# Altium project Master.PrjPcb (part 1 of 3)
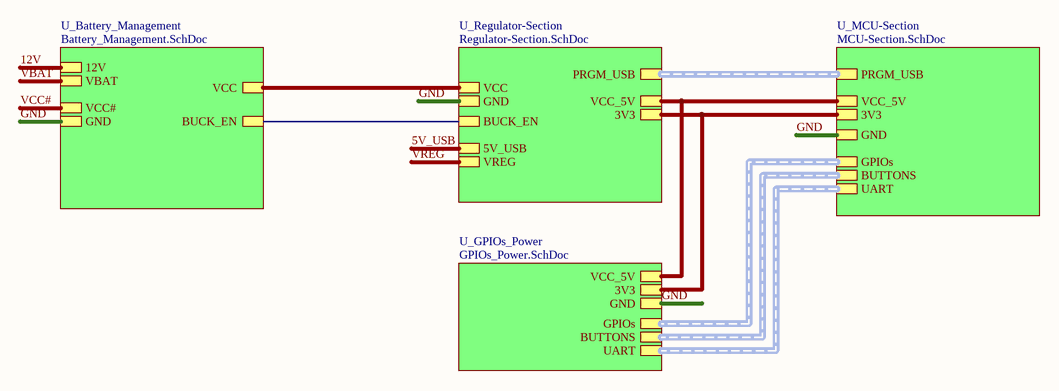
[diagram p0: Top_Sheet.SchDoc]
5 sheets, 132 parts. Net scope: hierarchical (ports join the sheet entries above them; power ports are global).
Board file: Catan_board.PcbDoc
Sheets:
  Top_Sheet.SchDoc
    U_Regulator-Section = Regulator-Section.SchDoc
    U_Battery_Management = Battery_Management.SchDoc
    U_MCU-Section = MCU-Section.SchDoc
    U_GPIOs_Power = GPIOs_Power.SchDoc

## Sheet Top_Sheet.SchDoc
size A4; SheetNumber: 1; SheetTotal: 5

### Sub-sheets
U_Battery_Management = Battery_Management.SchDoc: BUCK_EN, GND, VCC#, VCC, VBAT, 12V
U_GPIOs_Power = GPIOs_Power.SchDoc: 3V3, GND, VCC_5V, GPIOs (harness GPIOs), BUTTONS (harness BUTTONS), UART (harness UART)
U_MCU-Section = MCU-Section.SchDoc: 3V3, GND, VCC_5V, PRGM_USB (harness PRGM_USB), GPIOs (harness GPIOs), BUTTONS (harness BUTTONS), UART (harness UART)
U_Regulator-Section = Regulator-Section.SchDoc: BUCK_EN, 3V3, GND, VCC_5V, VCC, 5V_USB, VREG, PRGM_USB (harness PRGM_USB)

### Nets
3V3: sheet U_Regulator-Section/3V3, sheet U_MCU-Section/3V3, sheet U_GPIOs_Power/3V3
GND: sheet U_Regulator-Section/GND, sheet U_Battery_Management/GND, sheet U_MCU-Section/GND, sheet U_GPIOs_Power/GND
VCC: sheet U_Regulator-Section/VCC, sheet U_Battery_Management/VCC
VCC_5V: sheet U_Regulator-Section/VCC_5V, sheet U_MCU-Section/VCC_5V, sheet U_GPIOs_Power/VCC_5V
BUCK_EN: sheet U_Regulator-Section/BUCK_EN, sheet U_Battery_Management/BUCK_EN

### Buses and harness runs
harness sheet U_GPIOs_Power/BUTTONS = sheet U_MCU-Section/BUTTONS
harness sheet U_GPIOs_Power/GPIOs = sheet U_MCU-Section/GPIOs
harness sheet U_GPIOs_Power/UART = sheet U_MCU-Section/UART
harness sheet U_MCU-Section/PRGM_USB = sheet U_Regulator-Section/PRGM_USB

### Notes on the sheet
- File:
- Title:
- Date:
- Page
- Num:
- Total:
- Drawn By: Huzaifa Ali

## Sheet Regulator-Section.SchDoc
size A4; SheetNumber: 3; SheetTotal: 5
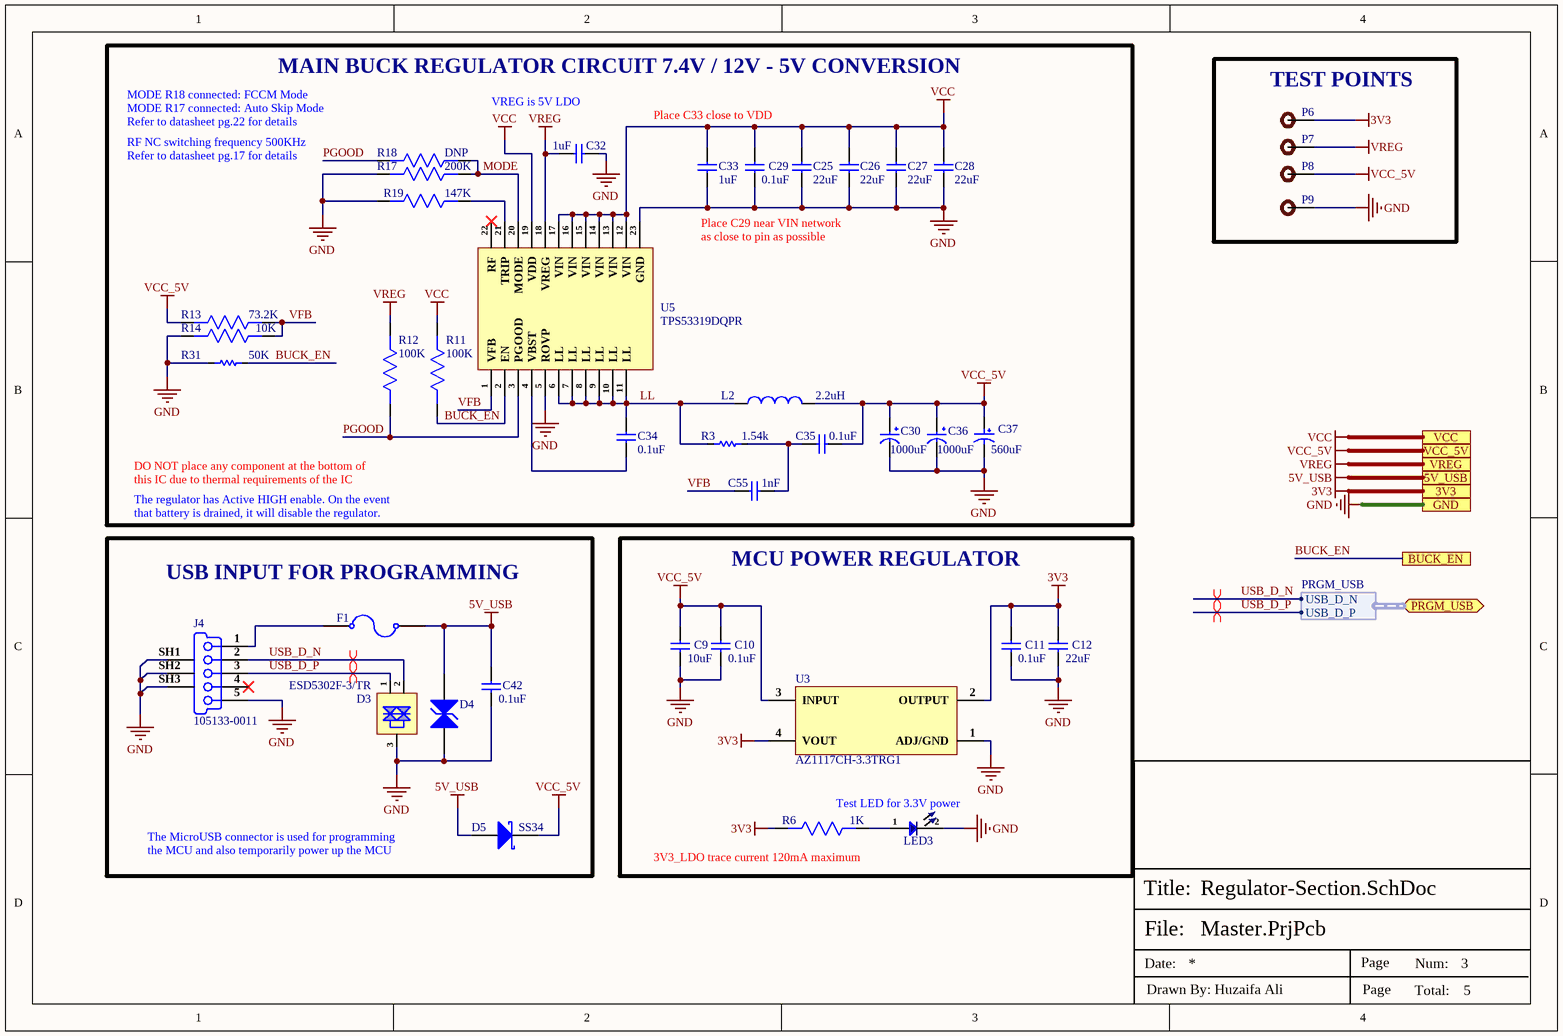
[diagram p1: Regulator-Section.SchDoc]

### Parts
C9  10uF  [Cap-0603]
C10  0.1uF  [Cap-0603]
C11  0.1uF  [Cap-0603]
C12  22uF  [Cap-0603]
C25  22uF  [Cap-0805]
C26  22uF  [Cap-0805]
C27  22uF  [Cap-0805]
C28  22uF  [Cap-0805]
C29  0.1uF  [Cap-0603]
C30  1000uF  [UUD1A102MNL1GS]
C32  1uF  [Cap-0603]
C33  1uF  [Cap-0603]
C34  0.1uF  [Cap-0603]
C35  0.1uF  [Cap-0603]
C36  1000uF  [UUD1A102MNL1GS]
C37  560uF  [GVT1C561M0810]
C42  0.1uF  [Cap-0603]
C55  1nF  [CAP-0603]
D3  ESD5302F-3/TR  [Sot-23]
D4  PESD5V0H1BSFYL  [DSN0603-2]  (value not drawn)
D5  SS34  [SMA]
F1  SMD0603-050  [Fuse-0603]  (value not drawn)
J4  105133-0011  [1051330011]
L2  2.2uH  [BCIH1367-2R2M]
LED3  RED  [LED-0603]  (value not drawn)
P6  TEST POINT  [Test-point]  (value not drawn)
P7  TEST POINT  [Test-point]  (value not drawn)
P8  TEST POINT  [Test-point]  (value not drawn)
P9  TEST POINT  [Test-point]  (value not drawn)
R3  1.54k  [Res-0402]
R6  1K  [Res-0603]
R11  100K  [Res-0603]
R12  100K  [Res-0603]
R13  73.2K  [Res-0603]
R14  10K  [Res-0603]
R17  200K  [Res-0603]
R18  DNP  [Res-0603]
R19  147K  [Res-0603]
R31  50K  [Res-0603]
U3  AZ1117CH-3.3TRG1  [SOT- 223]
U5  TPS53319DQPR  [22-LSON-CLIP (6x5)]

### Blocks framed on the sheet
MAIN BUCK REGULATOR CIRCUIT 7.4V / 12V - 5V CONVERSION: C25-C30 C32-C37 C55 L2 R3 R11-R14 R17-R19 R31 U5
TEST POINTS: P6-P9
USB INPUT FOR PROGRAMMING: C42 D3-D5 F1 J4
MCU POWER REGULATOR: C9-C12 LED3 R6 U3

### Ports
3V3, 5V_USB, BUCK_EN, GND, PRGM_USB (bidir, harness PRGM_USB), VCC, VCC_5V, VREG

### Harnesses
PRGM_USB: USB_D_N, USB_D_P

### Nets
3V3: C11.2 C12.2 P6.1 R6.2 U3.2(OUTPUT) U3.4(VOUT) ; port 3V3
5V_USB: C42.2 D4.1 D5.2(A) F1.2 ; port 5V_USB
GND: C9.1 C10.1 C11.1 C12.1 C25.1 C26.1 C27.1 C28.1 C29.1 C30.2 C32.2 C33.1 C36.2 C37.2 C42.1 D3.3(GND) D4.2 J4.5(GND) J4.SH1 J4.SH2 J4.SH3 LED3.2 P9.1 R14.1 R17.2 R19.2 R31.1 U3.1(ADJ/GND) U5.5(ROVP) U5.23(GND) ; port GND
VCC: C25.2 C26.2 C27.2 C28.2 C29.2 C33.2 R11.1 U5.12(VIN) U5.13(VIN) U5.14(VIN) U5.15(VIN) U5.16(VIN) U5.17(VIN) U5.19(VDD) ; port VCC
VCC_5V: C9.2 C10.2 C30.1 C35.1 C36.1 C37.1 D5.1(K) L2.2 P8.1 R13.2 U3.3(INPUT) ; port VCC_5V
VREG: C32.1 P7.1 R12.1 U5.18(VREG) ; port VREG
BUCK_EN: R11.2 R31.2 U5.2(EN) ; port BUCK_EN
LL: C34.1 L2.1 R3.1 U5.6(LL) U5.7(LL) U5.8(LL) U5.9(LL) U5.10(LL) U5.11(LL)
MODE: R17.1 R18.1 U5.20(MODE)
PGOOD: R12.2 R18.2 U5.3(PGOOD)
USB_D_N: D3.2(I/O2) J4.2(D-) ; port PRGM_USB.USB_D_N
USB_D_P: D3.1(I/O1) J4.3(D+) ; port PRGM_USB.USB_D_P
VFB: C55.2 R13.1 R14.2 U5.1(VFB)
NetC34_2: C34.2 U5.4(VBST)
NetC35_2: C35.2 C55.1 R3.2
NetF1_1: F1.1 J4.1(V_BUS_(5V))
NetLED3_1: LED3.1 R6.1
NetR19_1: R19.1 U5.21(TRIP)

Not connected (* = marked no-connect by the designer): J4 4(ID)*; U5 22(RF)*

### Layout directives
differential pair; net class USB; differential pair class USB_Lines; rule Impedance Constraint [Min = 85.00    Max = 90.00    ]; rule Matched Net Lengths [Tolerance = 50mil]: USB_D_N, USB_D_P
differential pair: USB_D_N, USB_D_P

### Notes on the sheet
- VREG is 5V LDO
- Place C33 close to VDD pin
- RF NC switching frequency 500KHz
  Refer to datasheet pg.17 for details
- MODE R18 connected: FCCM Mode
  MODE R17 connected: Auto Skip Mode
  Refer to datasheet pg.22 for details
- Place C29 near VIN network as close to pin as possible
- DO NOT place any component at the bottom of this IC due to thermal requirements of the IC
- The regulator has Active HIGH enable. On the event that battery is drained, it will disable the regulator.
- The MicroUSB connector is used for programming the MCU and also temporarily power up the MCU
- Test LED for 3.3V power
- (near R6) 3V3_LDO trace current 120mA maximum
- File:
- Title:
- Date:
- Page
- Num:
- Total:
- Drawn By: Huzaifa Ali

### Library data of the parts
C9 = CL10A106MA8NRNC: CAP CER 10UF 25V X5R 0603; Manufacturer: Samsung; Tolerance: 20%; Supplier 1: Avnet; Manufacturer Part Number: CL10A106MA8NRNC; RoHS: Yes; Category: Ceramic Capacitors; Pricing 1: 4000=0.03753, 8000=0.03700, 16000=0.03595, 24000=0.03515, 32000=0.03383, 40000=0.03304, 400000=0.03225 (USD); Mount: Surface Mount; Case/Package: 0603; Case Code (Metric): 1608; Case Code (Imperial): 0603; Contact Plating: Tin; Min Operating Temperature: -55°C; Max Operating Temperature: 85°C; Package Quantity: 1; Packaging: Tape and Reel; Capacitance: 10uF; Voltage Rating: 25V; Dielectric: X5R; Termination: Wraparound; Series: CL; Construction: Flat; Length: 0.063inch; Width: 0.031inch; Thickness: 0.035inch; Lead Free: Lead Free; RoHS Compliant: Yes; ComponentLink1URL: https://datasheet.ciiva.com/25766/cl10a106ma8nrnc-25766562.pdf?src-supplier=Digi-Key; ComponentLink1Description: https://datasheet.ciiva.com/25766/cl10a106ma8nrnc-25766562.pdf?src-supplier=Digi-Key; Supplier Part Number 1: CL10A106MA8NRNC; LCSC Part Number: C96446
C10 C11 C29 C34 C35 C42 = CC0603KRX5R9BB104: CAP CER 0.1UF 50V X5R 0603; Manufacturer: Yageo; Capacitance: 100nF; Tolerance: 10%; Item Type: Capacitor; Supplier 1: Digi-Key; Manufacturer Part Number: CC0603KRX5R9BB104; RoHS: Yes; Category: Ceramic Capacitors; Stock 1: 152253; Pricing 1: 1=0.10000, 10=0.05200, 50=0.02820, 100=0.02310, 500=0.01648, 1000=0.01294 (USD); Mount: Surface Mount; Case/Package: 0603; Case Code (Imperial): 0603; Case Code (Metric): 1608; Weight: 7.1E-05oz; Min Operating Temperature: -55°C; Max Operating Temperature: 85°C; Packaging: Tape and Reel; Voltage Rating: 50V; Dielectric: X5R; Termination: SMD/SMT; Voltage Rating (DC): 50V; Package Quantity: 4000; Length: 0.063inch; Width: 0.031inch; Thickness: 0.035inch; Lead Free: Lead Free; Halogen Free: Halogen Free; ComponentLink1URL: http://www.mouser.com/ds/2/447/Yageo_UPY-GP_NP0_16V-to-50V_9-358835.pdf?src-supplier=Mouser; ComponentLink1Description: http://www.mouser.com/ds/2/447/Yageo_UPY-GP_NP0_16V-to-50V_9-358835.pdf?src-supplier=Mouser; ComponentLink2URL: https://www.yageo.com/upload/media/product/productsearch/datasheet/mlcc/UPY-GPHC_X5R_4V-to-50V_26.pdf?src-supplier=Digi-Key; ComponentLink2Description: https://www.yageo.com/upload/media/product/productsearch/datasheet/mlcc/UPY-GPHC_X5R_4V-to-50V_26.pdf?src-supplier=Digi-Key; ComponentLink3URL: http://www.yageo.com/exep/pages/download/literatures/ProductSelectionGuide%202014_Final_2.pdf?src-supplier=Digi-Key; ComponentLink3Description: http://www.yageo.com/exep/pages/download/literatures/ProductSelectionGuide%202014_Final_2.pdf?src-supplier=Digi-Key; Supplier Part Number 1: 311-4046-1-ND; LCSC Part Number: C110022
C12 = CC0603MRX5R6BB226: CAP CER 22UF 10V X5R 0603; Manufacturer: Yageo; Tolerance: 20%; Supplier 1: Digi-Key; Manufacturer Part Number: CC0603MRX5R6BB226; RoHS: Yes; Category: Ceramic Capacitors; Stock 1: 19628; Pricing 1: 1=0.68000, 10=0.48000, 50=0.36300, 100=0.31610, 500=0.23416, 1000=0.19903 (USD); Mount: Surface Mount; Case/Package: 0603; Case Code (Metric): 1608; Case Code (Imperial): 0603; Weight: 7.1E-05oz; Min Operating Temperature: -55°C; Max Operating Temperature: 85°C; Packaging: Tape and Reel; Capacitance: 22uF; Voltage Rating: 10V; Dielectric: X5R; Termination: SMD/SMT; Voltage Rating (DC): 10V; Package Quantity: 4000; Length: 0.063inch; Width: 0.8mm; Height: 0.8mm; Thickness: 0.035inch; Lead Free: Lead Free; Halogen Free: Halogen Free; RoHS Compliant: Yes; ComponentLink1URL: http://www.mouser.com/ds/2/447/Yageo_UPY-GP_NP0_16V-to-50V_9-358835.pdf?src-supplier=Mouser; ComponentLink1Description: http://www.mouser.com/ds/2/447/Yageo_UPY-GP_NP0_16V-to-50V_9-358835.pdf?src-supplier=Mouser; ComponentLink2URL: http://www.yageo.com/documents/recent/UPY-GPHC_X5R_4V-to-50V_25.pdf?src-supplier=Digi-Key; ComponentLink2Description: http://www.yageo.com/documents/recent/UPY-GPHC_X5R_4V-to-50V_25.pdf?src-supplier=Digi-Key; Supplier Part Number 1: 311-1819-1-ND; LCSC Part Number: C109447
C25-C28 = C2012X5R1V226MT000E: CAP CER 22UF 35V X5R 0805; Manufacturer: TDK Corporation; Item Type: Capacitor; Manufacturer Part Number: C2012X5R1V226MT000E; Package: 0805; ComponentLink1Description: LCSC; ComponentLink1URL: https://www.lcsc.com/product-detail/Multilayer-Ceramic-Capacitors-MLCC-SMD-SMT_TDK-C2012X5R1V226M125AC_C2179409.html; LCSC Part Number: C338080
C30 C36 = UUD1A102MNL1GS: CAP ALUM 1000UF 20% 10V SMD; Manufacturer: Nichicon; Dielectric Material: Aluminium; Ripple Current: 670mA; Impedance: 90mR; Value: 1mF; Leakage Current: 3uA; Life (Hours): 5000Hour; Dissipation Factor: 0.24%; Lead Diameter: 1.1mm; Item Type: Capacitor; Supplier 1: Arrow Electronics; Manufacturer Part Number: UUD1A102MNL1GS; RoHS: Yes; Category: Aluminum Electrolytic Capacitors; Stock 1: 26500; Pricing 1: 500=0.33690, 1000=0.29090, 2500=0.27810, 5000=0.26240, 12500=0.24280, 25000=0.24040 (USD); Case/Package: Radial; Pins: 2; Min Operating Temperature: -55°C; Max Operating Temperature: 105°C; Tolerance: 20%; Package Quantity: 1; Voltage Rating (DC): 10V; Ripple Current (AC): 670mA; Packaging: Tape and Reel; Voltage Rating: 10V; Termination: SMD/SMT; Voltage: 10V; Series: UD; Construction: Cylindrical; Diameter: 10mm; Length: 10mm; Height: 10mm; Lead Pitch: 4.5mm; Height - Seated (Max): 0.394inch; Radiation Hardening: No; Reach SVHC Compliant: Yes; Lead Free: Lead Free; RoHS Compliant: Yes; ComponentLink1URL: https://datasheet.ciiva.com/98/e-ud-98263.pdf?src-supplier=Digi-Key; ComponentLink1Description: https://datasheet.ciiva.com/98/e-ud-98263.pdf?src-supplier=Digi-Key; ComponentLink2URL: https://datasheet.ciiva.com/16502/e-ud-16502759.pdf?src-supplier=Future+Electronics; ComponentLink2Description: https://datasheet.ciiva.com/16502/e-ud-16502759.pdf?src-supplier=Future+Electronics; ComponentLink3URL: https://datasheet.ciiva.com/98/e-ud-98264.pdf?src-supplier=Digi-Key; ComponentLink3Description: https://datasheet.ciiva.com/98/e-ud-98264.pdf?src-supplier=Digi-Key; ComponentLink4URL: https://datasheet.ciiva.com/28458/e-ud-28458024.pdf?src-supplier=Element14; ComponentLink4Description: https://datasheet.ciiva.com/28458/e-ud-28458024.pdf?src-supplier=Element14; ComponentLink5URL: https://datasheet.ciiva.com/98/e-ud-98265.pdf?src-supplier=Digi-Key; ComponentLink5Description: https://datasheet.ciiva.com/98/e-ud-98265.pdf?src-supplier=Digi-Key; ComponentLink6URL: https://datasheet.ciiva.com/7793/66055-7793131.pdf?src-supplier=Element14; ComponentLink6Description: https://datasheet.ciiva.com/7793/66055-7793131.pdf?src-supplier=Element14; ComponentLink7URL: https://datasheet.ciiva.com/22693/66055-22693549.pdf?src-supplier=Element14; ComponentLink7Description: https://datasheet.ciiva.com/22693/66055-22693549.pdf?src-supplier=Element14; Supplier Part Number 1: UUD1A102MNL1GS; LCSC Part Number: C445277
C32 C33 = CC0603KRX5R8BB105: CAP CER 1UF 25V X5R 0603; Manufacturer: Yageo; Tolerance: 10%; Item Type: Capacitor; Supplier 1: Digi-Key; Manufacturer Part Number: CC0603KRX5R8BB105; RoHS: Yes; Category: Ceramic Capacitors; Stock 1: 919939; Pricing 1: 1=0.12000, 10=0.08400, 50=0.04760, 100=0.03940, 500=0.02764, 1000=0.02288 (USD); Mount: Surface Mount; Case/Package: 0603; Number of Pins: 2; Case Code (Metric): 1608; Case Code (Imperial): 0603; Min Operating Temperature: -55°C; Max Operating Temperature: 85°C; Capacitance: 1uF; Dielectric: X5R; Package Quantity: 1; Voltage Rating: 25V; Packaging: Tape and Reel; Termination: SMD/SMT; Voltage Rating (DC): 25V; Series: CC; Construction: Flat; Length: 1.6mm; Width: 0.031inch; Height: 0.8mm; Thickness: 0.035inch; Depth: 0.8mm; Radiation Hardening: No; REACH SVHC: No SVHC; Lead Free: Lead Free; Halogen Free: Halogen Free; RoHS Compliant: Yes; ComponentLink1URL: https://datasheet.ciiva.com/176/mlccorderingcode-176785.pdf?src-supplier=Digi-Key; ComponentLink1Description: https://datasheet.ciiva.com/176/mlccorderingcode-176785.pdf?src-supplier=Digi-Key; ComponentLink2URL: https://datasheet.ciiva.com/176/mlccorderingcode-176786.pdf?src-supplier=Digi-Key; ComponentLink2Description: https://datasheet.ciiva.com/176/mlccorderingcode-176786.pdf?src-supplier=Digi-Key; ComponentLink3URL: https://datasheet.ciiva.com/176/mlccorderingcode-176787.pdf?src-supplier=Digi-Key; ComponentLink3Description: https://datasheet.ciiva.com/176/mlccorderingcode-176787.pdf?src-supplier=Digi-Key; ComponentLink4URL: https://datasheet.ciiva.com/17436/upy-gphc-x5r-4v-to-50v-12-17436952.pdf?src-supplier=Avnet+Europe; ComponentLink4Description: https://datasheet.ciiva.com/17436/upy-gphc-x5r-4v-to-50v-12-17436952.pdf?src-supplier=Avnet+Europe; ComponentLink5URL: https://datasheet.ciiva.com/7978/1525783-7978171.pdf?src-supplier=Element14; ComponentLink5Description: https://datasheet.ciiva.com/7978/1525783-7978171.pdf?src-supplier=Element14; ComponentLink6URL: https://datasheet.ciiva.com/11586/upy-gphc-x5r-4v-to-50v-12-11586318.pdf?src-supplier=Avnet; ComponentLink6Description: https://datasheet.ciiva.com/11586/upy-gphc-x5r-4v-to-50v-12-11586318.pdf?src-supplier=Avnet; Supplier Part Number 1: 311-1445-1-ND; LCSC Part Number: C14664
C37 = GVT1C561M0810: 560uF 16V ±20% SMD,D8xL10.5mm Aluminum Electrolytic Capacitors - SMD ROHS; Manufacturer: Honor Elec; Manufacturer Part Number: GVT1C561M0810; Package: SMD,D8xL10.5mm; LCSC Part Number: C2980166; Item Type: Capacitor; ComponentLink1Description: LCSC; ComponentLink1URL: https://www.lcsc.com/product-detail/span-style-background-color-ff0-Aluminum-span-span-style-background-color-ff0-Electrolytic-span-span-style-background-color-ff0-Capacitors-span-span-style-background-color-ff0-SMD-span_Honor-Elec-GVT1C561M0810_C2980166.html
C55 = CC0603JRNPO8BN102: CAP CER 1000PF 25V C0G/NPO 0603; Manufacturer: Yageo; Tolerance: 5%; Dielectric: C0G; Supplier 1: Digi-Key; Manufacturer Part Number: CC0603JRNPO8BN102; Stock 1: 290818; Pricing 1: 1=0.1, 10=0.072, 50=0.0394, 100=0.0322, 500=0.02298, 1000=0.01806 (USD); Mount: Surface Mount; Case/Package: 0603; Case Code (Metric): 1608; Case Code (Imperial): 0603; Min Operating Temperature: -55°C; Max Operating Temperature: 125°C; Capacitance: 1nF; Voltage Rating: 25V; Packaging: Tape and Reel; Package Quantity: 1; Termination: SMD/SMT; Voltage Rating (DC): 25V; Series: CC; Construction: Flat; Length: 1.6mm; Width: 0.031inch; Height: 0.8mm; Thickness: 0.035inch; Depth: 0.8mm; Radiation Hardening: No; REACH SVHC: Unknown; Lead Free: Lead Free; RoHS Compliant: Yes; ComponentLink1URL: http://www.farnell.com/datasheets/1132289.pdf?src-supplier=Element14; ComponentLink1Description: http://www.farnell.com/datasheets/1132289.pdf?src-supplier=Element14; ComponentLink2URL: http://www.farnell.com/datasheets/2213336.pdf?src-supplier=Element14; ComponentLink2Description: http://www.farnell.com/datasheets/2213336.pdf?src-supplier=Element14; ComponentLink3URL: http://www.yageo.com/documents/recent/UPY-GP_NP0_16V-to-50V_16.pdf?src-supplier=Digi-Key; ComponentLink3Description: http://www.yageo.com/documents/recent/UPY-GP_NP0_16V-to-50V_16.pdf?src-supplier=Digi-Key; ComponentLink4URL: http://www.yageo.com/exep/pages/download/literatures/ProductSelectionGuide%202014_Final_2.pdf?src-supplier=Digi-Key; ComponentLink4Description: http://www.yageo.com/exep/pages/download/literatures/ProductSelectionGuide%202014_Final_2.pdf?src-supplier=Digi-Key; ComponentLink5URL: http://www.yageo.com/documents/recent/UPY-GP_NP0_16V-to-50V_8.pdf?src-supplier=Avnet; ComponentLink5Description: http://www.yageo.com/documents/recent/UPY-GP_NP0_16V-to-50V_8.pdf?src-supplier=Avnet; ComponentLink6URL: https://www.verical.com/server-webapp/html/getDatasheet?partID=403523&src-supplier=Verical; ComponentLink6Description: https://www.verical.com/server-webapp/html/getDatasheet?partID=403523&src-supplier=Verical; ComponentLink7URL: http://www.yageo.com/documents/recent/UPY-GP_NP0_16V-to-50V_8.pdf?src-supplier=Avnet+Europe; ComponentLink7Description: http://www.yageo.com/documents/recent/UPY-GP_NP0_16V-to-50V_8.pdf?src-supplier=Avnet+Europe; Supplier Part Number 1: 311-1342-1-ND; LCSC Part Number: C309470
D3 = ESD5302F-3/TR: 16A 20V 7V 5V@Max Unidirectional SOT-23 TVS ROHS; Manufacturer: WILLSEMI; Item Type: Diode; Manufacturer Part Number: ESD5302F-3/TR; Package: SOT-23; LCSC Part Number: C239643; ComponentLink1Description: LCSC; ComponentLink1URL: https://www.lcsc.com/product-detail/TVS_WILLSEMI-Will-Semicon-ESD5302F-3-TR_C239643.html
D4 = PESD5V0H1BSFYL: TVS DIODE 5VWM 6.3VC DSN0603-2; Manufacturer: Nexperia; Supplier 1: Avnet; Manufacturer Part Number: PESD5V0H1BSFYL; RoHS: Yes; Category: ESD and Circuit Protection ICs; Stock 1: 9000; Pricing 1: 18000=0.06453, 36000=0.06278, 54000=0.06104, 90000=0.05930, 180000=0.05755, 900000=0.05581, 1800000=0.05406 (USD); RoHS Compliant: Yes; ComponentLink1URL: http://www.farnell.com/datasheets/1961312.pdf?src-supplier=Farnell; ComponentLink1Description: http://www.farnell.com/datasheets/1961312.pdf?src-supplier=Farnell; ComponentLink2URL: https://assets.nexperia.com/documents/data-sheet/PESD5V0H1BSF.pdf?src-supplier=Digi-Key; ComponentLink2Description: https://assets.nexperia.com/documents/data-sheet/PESD5V0H1BSF.pdf?src-supplier=Digi-Key; ComponentLink3URL: http://www.farnell.com/datasheets/1961312.pdf?src-supplier=Newark; ComponentLink3Description: http://www.farnell.com/datasheets/1961312.pdf?src-supplier=Newark; Supplier Part Number 1: PESD5V0H1BSFYL; LCSC Part Number: C477989; Item Type: Diode
D5 = SS34: 0.5mA@40V 40V Single 3A 0.55V@3A SMA(DO-214AC) Schottky Barrier Diodes (SBD) ROHS; Manufacturer: MDD; Item Type: Diode; Manufacturer Part Number: SS34; Package: SMA(DO-214AC); LCSC Part Number: C8678; ComponentLink1Description: LCSC; ComponentLink1URL: https://www.lcsc.com/product-detail/Schottky-Barrier-Diodes-SBD_MDD-Microdiode-Electronics-SS34_C8678.html
F1 = SMD0603-050: 6V 500mA 40A 1A 0603 Resettable Fuses ROHS; Manufacturer: TECHFUSE; Supplier 1: LCSC; Manufacturer Part Number: SMD0603-050; RoHS: No; Category: Uncategorized; Supplier Part Number 1: C69679
J4 = 105133-0011: CONN RCPT USB2.0 MICRO B SMD; Manufacturer: Molex; Connector Type: TELECOM AND DATACOM CONNECTOR; Option: General Purpose; Contact Resistance: 30mR; Contact Style: USB; Dielectric Withstanding Voltage (AC): 140V; Durability: 10000Cycles; Empty Shell: No; Insulation Resistance: 1GR; Number Of Connectors: 1; PCB Contact Pattern: RECTANGULAR; Polarization Key: POLARIZED HOUSING; Rated Current (Signal): 1A; Number of Contacts: 5; Body Breadth: 0.118inch; Body Depth: 0.264inch; Body Length: 0.315inch; Mounting Option 1: LOCKING; Reference Standard: UL; Reliability: COMMERCIAL; Item Type: USB Connector; Supplier 1: Avnet; Manufacturer Part Number: 105133-0011; RoHS: Yes; Category: USB Connectors; Stock 1: 12800; Pricing 1: 500=1.01170 (USD); Mounting Technology: Board; Contact Material: Copper Alloy; Contact Finish - Mating: NOT SPECIFIED; Contact Finish - Termination: Gold (Au) - with Nickel (Ni) barrier; Insulation Material: Polyethylene; Shell Finish: Tin; Shell Material: Stainless Steel; Min Operating Temperature: -30°C; Max Operating Temperature: 85°C; JESD-609 Code: e4; Contact Gender: Female; Filter Feature: No; Mixed Contacts: No; Mounting Style: STRAIGHT; Number Of PCB Rows: 1; Termination: SMD/SMT; Terminal Pitch: 0.6604mm; Flammability Rating: UL94 V-0; Reach SVHC Compliant: Yes; RoHS Compliant: Yes; DIN Conformance: No; IEC Conformance: No; MIL Conformance: No; ComponentLink1URL: https://datasheet.ciiva.com:443/pdfs/VipMasterIC/IC/MOLE/MOLE-S-A0000025294/MOLE-S-A0000025294-1.pdf?src-supplier=IHS+Markit; ComponentLink1Description: https://datasheet.ciiva.com:443/pdfs/VipMasterIC/IC/MOLE/MOLE-S-A0000025294/MOLE-S-A0000025294-1.pdf?src-supplier=IHS+Markit; ComponentLink2URL: https://datasheet.ciiva.com/29660/1051330011-sd-29660273.pdf?src-supplier=Digi-Key; ComponentLink2Description: https://datasheet.ciiva.com/29660/1051330011-sd-29660273.pdf?src-supplier=Digi-Key; ComponentLink3URL: https://datasheet.ciiva.com/15181/getdatasheetpartid-719072-15181485.pdf?src-supplier=Verical; ComponentLink3Description: https://datasheet.ciiva.com/15181/getdatasheetpartid-719072-15181485.pdf?src-supplier=Verical; Supplier Part Number 1: 105133-0011; LCSC Part Number: C586226
L2 = BCIH1367-2R2M: 22A 2.2uH ±20% SMD Power Inductors ROHS; Manufacturer: BC(Bao Cheng Elec); Manufacturer Part Number: BCIH1367-2R2M; Package: SMD; LCSC Part Number: C237973; Item Type: Inductor; ComponentLink1Description: LCSC; ComponentLink1URL: https://www.lcsc.com/product-detail/Power-Inductors_BC-Bao-Cheng-Elec-BCIH1367-2R2M_C237973.html
LED3 = NCD0603R3: 0603 Light Emitting Diodes (LED) ROHS; Manufacturer: Foshan NationStar Optoelectronics; Manufacturer Part Number: NCD0603R3; Package: 0603; Item Type: LED; LCSC Part Number: C3151730; ComponentLink1Description: LCSC; ComponentLink1URL: https://www.lcsc.com/product-detail/Light-Emitting-Diodes-LED_Foshan-NationStar-Optoelectronics-NCD0603R3_C3151730.html
P6-P9 = TEST POINT: Test Point ON
R3 = WR04X1541FTL: 62.5mW Thick Film Resistors ±1% 1.54kΩ 0402 Chip Resistor - Surface Mount ROHS; Manufacturer: Walsin Tech Corp; Manufacturer Part Number: WR04X1541FTL; LCSC Part Number: C396136; Package: 0402; Item Type: Resistor; ComponentLink1Description: LCSC; ComponentLink1URL: https://www.lcsc.com/product-detail/Chip-Resistor-Surface-Mount_Walsin-Tech-Corp-WR04X1541FTL_C396136.html
R6 = RT0603DRD071KL: RES SMD 1K OHM 0.5% 1/10W 0603; Manufacturer: Yageo; Resistance: 1kR; Temperature Coefficient: 25ppm/°C; Power Rating: 100mW; Voltage Rating: 75V; Voltage Rating (DC): 50V; Supplier 1: Digi-Key; Manufacturer Part Number: RT0603DRD071KL; Stock 1: 178947; Pricing 1: 1=0.2, 10=0.167, 100=0.0651, 1000=0.02725, 2500=0.02498 (USD); Case/Package: 0603; Contact Plating: Tin,Matte; Case Code (Metric): 1608; Case Code (Imperial): 0603; Min Operating Temperature: -55°C; Max Operating Temperature: 125°C; Tolerance: 0.5%; Composition: Thin Film; Packaging: Tape and Reel; Termination: SMD/SMT; Radiation Hardening: No; Lead Free: Lead Free; ComponentLink1URL: http://www.mouser.com/ds/2/447/yageodocoutput-1125656.pdf?src-supplier=Mouser; ComponentLink1Description: http://www.mouser.com/ds/2/447/yageodocoutput-1125656.pdf?src-supplier=Mouser; ComponentLink2URL: http://www.yageo.com/documents/recent/PYu-RT_1-to-0.05_RoHS_L_6.pdf?src-supplier=Avnet; ComponentLink2Description: http://www.yageo.com/documents/recent/PYu-RT_1-to-0.05_RoHS_L_6.pdf?src-supplier=Avnet; Supplier Part Number 1: 311-1.0KDDKR-ND; LCSC Part Number: C165964
R11 R12 = RC0603JR-07100KL: RES 100K OHM 5% 1/10W 0603; Manufacturer: Yageo; Resistance: 100kR; Temperature Coefficient: 100ppm/°C; Voltage Rating: 50V; Power Rating: 100mW; Supplier 1: Digi-Key; Manufacturer Part Number: RC0603JR-07100KL; RoHS: Yes; Category: Chip SMD Resistors; Stock 1: 1210037; Pricing 1: 1=0.10000, 10=0.02000, 100=0.00800, 1000=0.00360, 2500=0.00312 (USD); Case/Package: 0603; Number of Pins: 2; Contact Plating: Tin,Matte; Case Code (Imperial): 0603; Case Code (Metric): 1608; Size Code: 0603; Min Operating Temperature: -55°C; Max Operating Temperature: 155°C; Tolerance: 5%; Resistor Type: Thick Film; Packaging: Tape and Reel; Voltage Rating (DC): 50V; Termination: SMD/SMT; Features: Moisture Resistant; Series: RC; Max Power Dissipation: 100mW; Number of Terminations: 2; Resistance Tolerance: 5%; Width: 0.8mm; Radiation Hardening: No; REACH SVHC: No SVHC; Lead Free: Lead Free; RoHS Compliant: Yes; ComponentLink1URL: https://datasheet.ciiva.com/7746/443971-7746424.pdf?src-supplier=Element14; ComponentLink1Description: https://datasheet.ciiva.com/7746/443971-7746424.pdf?src-supplier=Element14; ComponentLink2URL: https://datasheet.ciiva.com/7983/443971-7983686.pdf?src-supplier=Element14; ComponentLink2Description: https://datasheet.ciiva.com/7983/443971-7983686.pdf?src-supplier=Element14; ComponentLink3URL: https://datasheet.ciiva.com/7746/443971-7746423.pdf?src-supplier=Element14; ComponentLink3Description: https://datasheet.ciiva.com/7746/443971-7746423.pdf?src-supplier=Element14; ComponentLink4URL: https://datasheet.ciiva.com/8887/pyu-rc0603-51-rohs-l-4-8887903.pdf?src-supplier=Avnet; ComponentLink4Description: https://datasheet.ciiva.com/8887/pyu-rc0603-51-rohs-l-4-8887903.pdf?src-supplier=Avnet; Supplier Part Number 1: 311-100KGRCT-ND; LCSC Part Number: C100048
R13 = RC0603FR-0773K2L: RES 73.2K OHM 1% 1/10W 0603; Manufacturer: Yageo; Value: 73.2kR; Temperature Coefficient: 100ppm/°C; Power Rating: 100mW; Voltage Rating: 50V; Item Type: Resistor; Supplier 1: Future Electronics; Manufacturer Part Number: RC0603FR-0773K2L; RoHS: Yes; Category: Chip SMD Resistors; Stock 1: 410000; Pricing 1: 5000=0.00150, 75000=0.00140, 250000=0.00130, 750000=0.00130, 2500000=0.00120 (USD); Case/Package: 0603; Contact Plating: Tin,Matte; Case Code (Imperial): 0603; Case Code (Metric): 1608; Min Operating Temperature: -55°C; Max Operating Temperature: 155°C; Tolerance: 1%; Resistor Type: Thick Film; Packaging: Tape and Reel; Termination: SMD/SMT; Voltage Rating (DC): 50V; Features: Moisture Resistant; Series: RC; Max Power Dissipation: 100mW; Number of Terminations: 2; Construction: Rectangular; Length: 1.6mm; Width: 0.8mm; Height: 0.45mm; Depth: 0.8mm; Military Standard: Not; Lead Free: Lead Free; RoHS Compliant: Yes; ComponentLink1URL: https://datasheet.ciiva.com/8888/pyu-rc0603-51-rohs-l-4-8888325.pdf?src-supplier=Avnet; ComponentLink1Description: https://datasheet.ciiva.com/8888/pyu-rc0603-51-rohs-l-4-8888325.pdf?src-supplier=Avnet; Supplier Part Number 1: 8036170; LCSC Part Number: C163420
R14 = AC0603JR-0710KL: RES SMD 10K OHM 5% 1/10W 0603; Manufacturer: Yageo; Voltage Rating: 50V; Resistance: 10kR; Power Rating: 100mW; Temperature Coefficient: 100ppm/°C; Item Type: Resistor; Supplier 1: Future Electronics; Manufacturer Part Number: AC0603JR-0710KL; RoHS: Yes; Category: Chip SMD Resistors; Stock 1: 1533000; Pricing 1: 5000=0.00540 (USD); Case/Package: 0603; Case Code (Imperial): 0603; Case Code (Metric): 1608; Size Code: 0603; Min Operating Temperature: -55°C; Max Operating Temperature: 155°C; Packaging: Tape and Reel; Tolerance: 5%; Package Quantity: 1; Resistor Type: Thick Film; Termination: SMD/SMT; Number of Terminations: 2; Max Power Dissipation: 100mW; Features: Moisture Resistant,Automotive AEC-Q200,Anti-Sulfur; Series: AC; Construction: Rectangular; Length: 0.063inch; Width: 0.031inch; Height: 0.022inch; Depth: 0.8mm; Military Standard: Not; Lead Free: Lead Free; RoHS Compliant: Yes; ComponentLink1URL: https://datasheet.ciiva.com/5562/pyu-ac-51-rohs-l-2-5562553.pdf?src-supplier=Mouser; ComponentLink1Description: https://datasheet.ciiva.com/5562/pyu-ac-51-rohs-l-2-5562553.pdf?src-supplier=Mouser; Supplier Part Number 1: 1029044; LCSC Part Number: C140867
R17 R18 = RC0603FR-07200KL: RES SMD 200K OHM 1% 1/10W 0603; Manufacturer: Yageo; Item Type: Resistor; Manufacturer Part Number: RC0603FR-07200KL; Package: 0603; ComponentLink3URL: https://www.lcsc.com/product-detail/Chip-Resistor-Surface-Mount_YAGEO-RC0603FR-07200KL_C105574.html; ComponentLink3Description: LCSC; LCSC Part Number: C105574
R19 = RT0603DRD07147KL: RES SMD 147K OHM 0.5% 1/10W 0603; Manufacturer: Yageo; Power Rating: 100mW; Voltage Rating (DC): 50V; Value: 147kR; Temperature Coefficient: 25ppm/°C; Item Type: Resistor; Supplier 1: Mouser; Manufacturer Part Number: RT0603DRD07147KL; RoHS: Yes; Category: Chip SMD Resistors; Stock 1: 1848; Pricing 1: 1=0.18000, 10=0.14700, 50=0.14700, 100=0.05600, 1000=0.02400, 10000=0.01800 (USD); Case/Package: 0603; Case Code (Imperial): 0603; Case Code (Metric): 1608; Min Operating Temperature: -55°C; Max Operating Temperature: 155°C; Package Quantity: 10; Tolerance: 0.5%; Packaging: Tape and Reel; Series: RT; Max Power Dissipation: 100mW; Number of Terminations: 2; Length: 1.6mm; Width: 0.8mm; Height: 0.45mm; Lead Free: Lead Free; RoHS Compliant: Yes; ComponentLink1URL: http://www.yageo.com/documents/recent/PYu-RT_1-to-0.01_RoHS_L_9.pdf?src-supplier=Digi-Key; ComponentLink1Description: http://www.yageo.com/documents/recent/PYu-RT_1-to-0.01_RoHS_L_9.pdf?src-supplier=Digi-Key; Supplier Part Number 1: 603-RT0603DRD07147KL; LCSC Part Number: C728612
R31 = PNM0603E5002BST5: RES SMD 50K OHM 0.1% 0.15W 0603; Manufacturer: Vishay Dale Thin Film; Resistance: 50kR; Temperature Coefficient: 25ppm/°C; Power Rating: 150mW; Voltage Rating: 75V; Supplier 1: Digi-Key; Manufacturer Part Number: PNM0603E5002BST5; Stock 1: 16518; Pricing 1: 1=3.07, 10=2.743, 100=2.0299 (USD); Case/Package: 0603; Contact Plating: Copper,Tin,Silver; Case Code (Imperial): 0603; Case Code (Metric): 1608; Min Operating Temperature: -55°C; Max Operating Temperature: 125°C; Tolerance: 0.1%; Composition: Thin Film; Packaging: Tape and Reel; Termination: SMD/SMT; Voltage Rating (DC): 75V; Length: 0.064inch; Height: 0.02inch; Width: 0.032inch; Radiation Hardening: No; REACH SVHC: Unknown; Supplier Part Number 1: PNM0603-50KBDKR-ND; LCSC Part Number: C2073717; ComponentLink1Description: LCSC; ComponentLink1URL: https://www.lcsc.com/product-detail/Chip-Resistor-Surface-Mount_Vishay-Intertech-PNM0603E5002BST5_C2073717.html
U3 = AZ1117CH-3.3TRG1: 15V 1.3V @ 800mA Fixed 3.3V SOT-223 Linear Voltage Regulators (LDO) ROHS; Manufacturer: Diodes Incorporated; Item Type: IC; Manufacturer Part Number: AZ1117CH-3.3TRG1; Package: SOT-223; LCSC Part Number: C92102
U5 = TPS53319DQPR: IC REG BUCK ADJUSTABLE 14A 22SON; Manufacturer: Texas Instruments; Output Voltage: 5.5V; Switching Frequency: 1MHz; Min Input Voltage: 1.5V; Max Input Voltage: 22V; Number of Outputs: 1; Synchronous Rectifier: Yes; Min Output Voltage: 600mV; Quiescent Current: 320uA; Output Configuration: Positive; Efficiency: 91%; Supplier 1: Newark; Manufacturer Part Number: TPS53319DQPR; RoHS: Yes; Category: Voltage Regulators - Switching; Mount: Surface Mount; Case/Package: SON; Number of Pins: 22; Contact Plating: Gold; Min Operating Temperature: -40°C; Max Operating Temperature: 85°C; Output Current: 14A; Package Quantity: 2500; Series: D-CAP™, Eco-Mode™; Packaging: Tape and Reel; Max Output Voltage: 5.5V; Output Type: Adjustable; Max Output Current: 14A; Radiation Hardening: No; Lead Free: Contains Lead; RoHS Compliant: Yes; ComponentLink1URL: https://datasheet.ciiva.com/6605/tps53318-6605682.pdf?src-supplier=Digi-Key; ComponentLink1Description: https://datasheet.ciiva.com/6605/tps53318-6605682.pdf?src-supplier=Digi-Key; ComponentLink2Description: LCSC; ComponentLink2URL: https://www.lcsc.com/product-detail/DC-DC-Converters_Texas-Instruments-TPS53319DQPR_C181971.html; LCSC Part Number: C181971; Item Type: IC